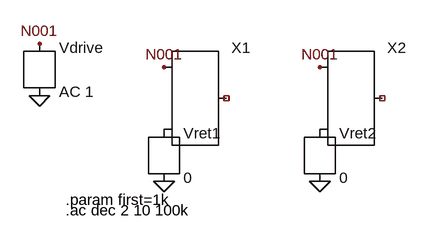
[diagram p0: schematic root.asc]
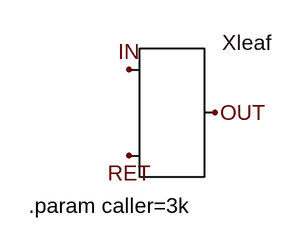
[diagram p1: sub-circuit wrapper.asc]
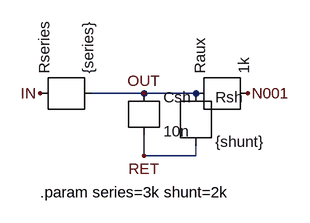
[diagram p2: sub-circuit leaf.asc]
root.asc, the LTspice schematic file:
Version 4
SHEET 1 880 680
FLAG 0 16 N001
FLAG 0 96 0
FLAG 192 52 N001
FLAG 432 52 N001
FLAG 192 228 0
FLAG 432 228 0
SYMBOL voltage 0 0 R0
SYMATTR InstName Vdrive
SYMATTR Value AC 1
SYMBOL voltage 192 132 R0
SYMATTR InstName Vret1
SYMATTR Value 0
SYMBOL voltage 432 132 R0
SYMATTR InstName Vret2
SYMATTR Value 0
SYMBOL wrapper 240 100 R0
SYMATTR InstName X1
SYMATTR SpiceLine caller={first}
SYMBOL wrapper 480 100 R0
SYMATTR InstName X2
SYMATTR SpiceLine caller=4k
TEXT 40 256 Left 2 !.param first=1k
TEXT 40 272 Left 2 !.ac dec 2 10 100k

wrapper.asc, the sub-circuit schematic file:
Version 4
SHEET 1 880 680
FLAG 112 80 IN
FLAG 112 176 RET
FLAG 208 128 OUT
SYMBOL leaf 160 128 R0
SYMATTR InstName Xleaf
SYMATTR SpiceLine series={caller}
TEXT 0 232 Left 2 !.param caller=3k

leaf.asc, the sub-circuit schematic file:
Version 4
SHEET 1 880 680
FLAG 0 80 IN
FLAG 160 80 OUT
FLAG 160 176 RET
FLAG 320 80 N001
WIRE 160 80 80 80
WIRE 240 80 160 80
WIRE 160 176 160 144
WIRE 240 176 160 176
WIRE 240 176 240 160
SYMBOL res -16 96 R270
SYMATTR InstName Rseries
SYMATTR Value {series}
SYMBOL cap 144 80 R0
SYMATTR InstName Csh
SYMATTR Value 10n
SYMBOL res 224 64 R0
SYMATTR InstName Rsh
SYMATTR Value {shunt}
SYMBOL res 224 96 R270
SYMATTR InstName Raux
SYMATTR Value 1k
TEXT 0 232 Left 2 !.param series=3k shunt=2k

The netlist it stands for:
* root.asc
XVdrive N001 0 AC 1
XVret1 P001 0 0
XVret2 P002 0 0
XX1 P001 N001 NC_01 wrapper params: caller={first}
XX2 P002 N001 NC_02 wrapper params: caller=4k

* block symbol definitions
.subckt wrapper RET IN OUT
XXleaf IN OUT RET leaf params: series={caller}
.param caller=3k
.ends wrapper

.subckt leaf IN OUT RET
XRseries IN OUT {series}
XCsh OUT RET 10n
XRsh OUT RET {shunt}
XRaux OUT N001 1k
.param series=3k shunt=2k
.ends leaf

.param first=1k
.ac dec 2 10 100k
.backanno
.end